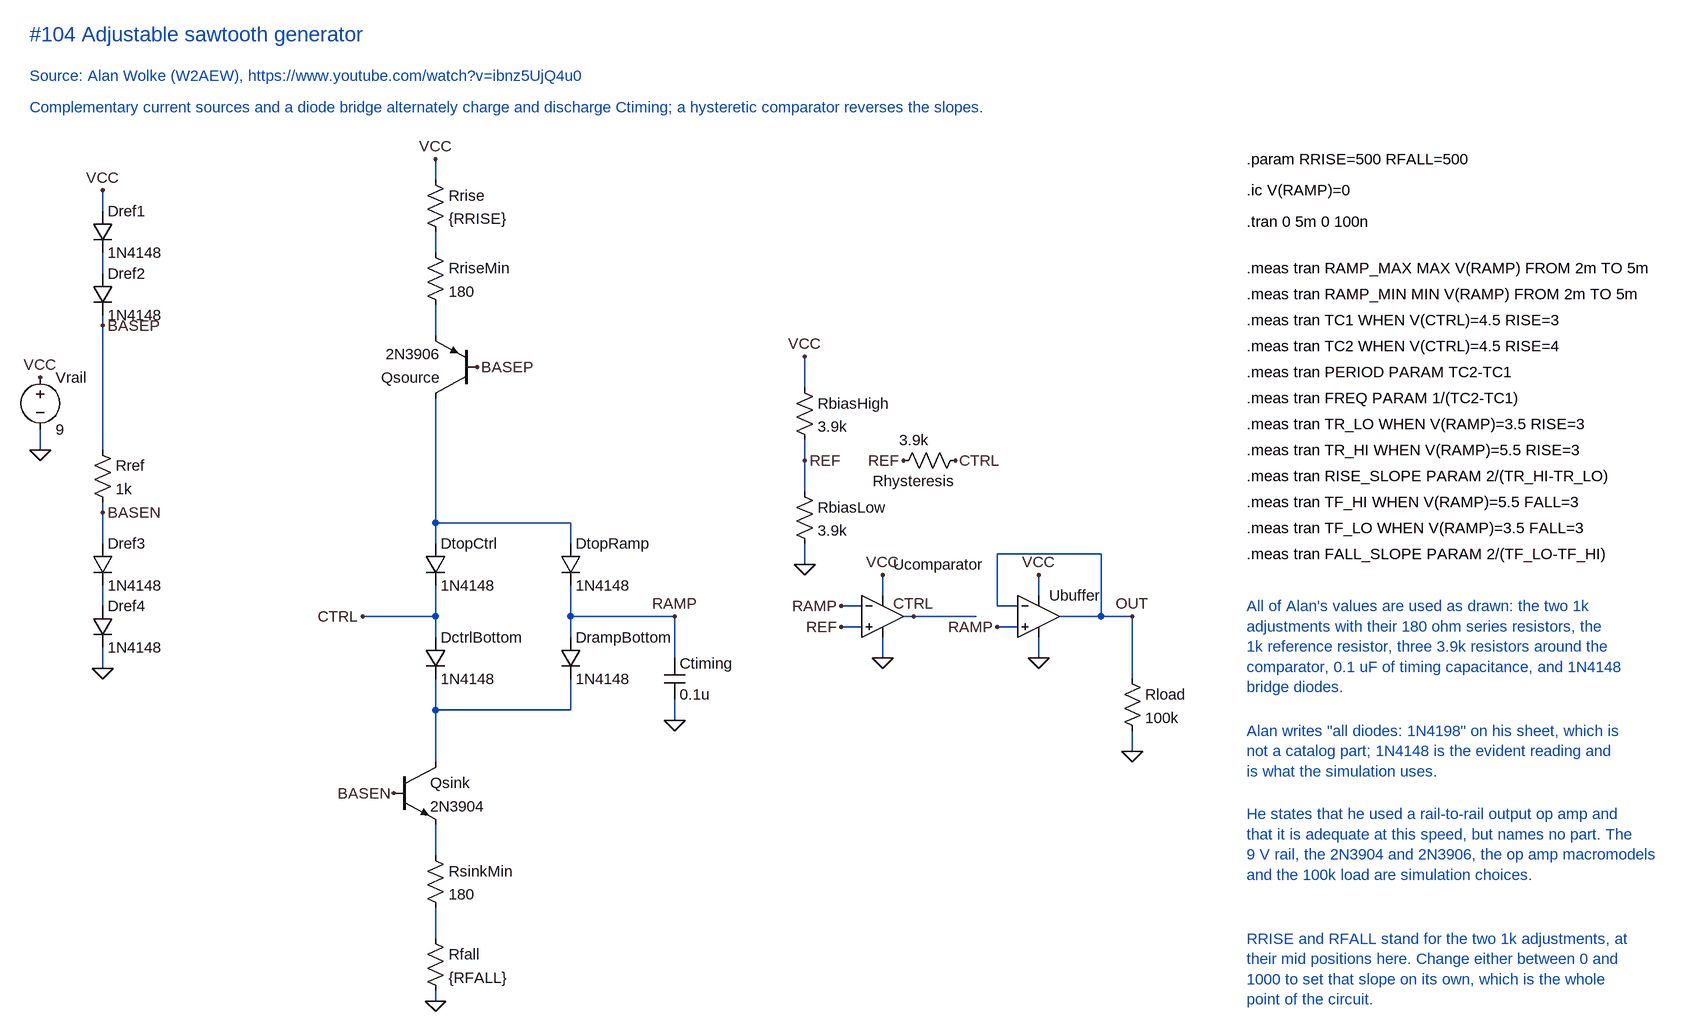
[diagram p0: schematic Adjustable sawtooth generator.asc]
Adjustable sawtooth generator.asc, the LTspice schematic file:
Version 4.1
SHEET 1 1900 1650
WIRE 64 80 64 48
WIRE 160 -320 160 -288
WIRE 160 -224 160 -192
WIRE 160 -128 160 -112
WIRE 160 -112 160 80
WIRE 160 160 160 176
WIRE 160 176 160 224
WIRE 160 288 160 320
WIRE 160 384 160 416
WIRE 672 -368 672 -336
WIRE 672 -256 672 -224
WIRE 672 -144 672 -96
WIRE 672 192 672 0
WIRE 672 224 672 192
WIRE 672 336 672 288
WIRE 672 368 672 336
WIRE 672 480 672 432
WIRE 672 560 672 480
WIRE 672 704 672 656
WIRE 672 832 672 784
WIRE 672 928 672 912
WIRE 880 192 672 192
WIRE 880 224 880 192
WIRE 880 336 880 288
WIRE 880 368 880 336
WIRE 880 480 880 432
WIRE 880 480 672 480
WIRE 560 336 672 336
WIRE 1040 336 880 336
WIRE 1040 400 1040 336
WIRE 1040 496 1040 464
WIRE 1240 -64 1240 -16
WIRE 1240 96 1240 64
WIRE 1240 144 1240 96
WIRE 1240 256 1240 224
WIRE 1360 304 1360 272
WIRE 1360 400 1360 368
WIRE 1296 320 1328 320
WIRE 1296 352 1328 352
WIRE 1504 336 1392 336
WIRE 1568 352 1536 352
WIRE 1600 304 1600 272
WIRE 1600 400 1600 368
WIRE 1696 336 1632 336
WIRE 1744 336 1696 336
WIRE 1744 432 1744 336
WIRE 1744 544 1744 512
WIRE 1696 240 1696 336
WIRE 1536 240 1696 240
WIRE 1536 320 1536 240
WIRE 1568 320 1536 320
FLAG 64 -32 VCC
FLAG 64 80 0
FLAG 160 -320 VCC
FLAG 160 -112 BASEP
FLAG 160 176 BASEN
FLAG 160 416 0
FLAG 672 -368 VCC
FLAG 736 -48 BASEP
FLAG 608 608 BASEN
FLAG 672 928 0
FLAG 560 336 CTRL
FLAG 1040 336 RAMP
FLAG 1040 496 0
FLAG 1240 -64 VCC
FLAG 1240 96 REF
FLAG 1240 256 0
FLAG 1392 96 REF
FLAG 1472 96 CTRL
FLAG 1296 320 RAMP
FLAG 1296 352 REF
FLAG 1360 272 VCC
FLAG 1360 400 0
FLAG 1408 336 CTRL
FLAG 1536 352 RAMP
FLAG 1600 272 VCC
FLAG 1600 400 0
FLAG 1744 336 OUT
FLAG 1744 544 0
SYMBOL voltage 64 -48 R0
SYMATTR InstName Vrail
SYMATTR Value 9
SYMBOL diode 144 -288 R0
SYMATTR InstName Dref1
SYMATTR Value 1N4148
SYMBOL diode 144 -192 R0
SYMATTR InstName Dref2
SYMATTR Value 1N4148
SYMBOL res 144 64 R0
SYMATTR InstName Rref
SYMATTR Value 1k
SYMBOL diode 144 224 R0
SYMATTR InstName Dref3
SYMATTR Value 1N4148
SYMBOL diode 144 320 R0
SYMATTR InstName Dref4
SYMATTR Value 1N4148
SYMBOL res 656 -352 R0
SYMATTR InstName Rrise
SYMATTR Value {RRISE}
SYMBOL res 656 -240 R0
SYMATTR InstName RriseMin
SYMATTR Value 180
SYMBOL pnp 736 0 R180
SYMATTR InstName Qsource
SYMATTR Value 2N3906
SYMBOL diode 656 224 R0
SYMATTR InstName DtopCtrl
SYMATTR Value 1N4148
SYMBOL diode 864 224 R0
SYMATTR InstName DtopRamp
SYMATTR Value 1N4148
SYMBOL diode 656 368 R0
SYMATTR InstName DctrlBottom
SYMATTR Value 1N4148
SYMBOL diode 864 368 R0
SYMATTR InstName DrampBottom
SYMATTR Value 1N4148
SYMBOL npn 608 560 R0
SYMATTR InstName Qsink
SYMATTR Value 2N3904
SYMBOL res 656 688 R0
SYMATTR InstName RsinkMin
SYMATTR Value 180
SYMBOL res 656 816 R0
SYMATTR InstName Rfall
SYMATTR Value {RFALL}
SYMBOL cap 1024 400 R0
SYMATTR InstName Ctiming
SYMATTR Value 0.1u
SYMBOL res 1224 -32 R0
SYMATTR InstName RbiasHigh
SYMATTR Value 3.9k
SYMBOL res 1224 128 R0
SYMATTR InstName RbiasLow
SYMATTR Value 3.9k
SYMBOL res 1376 112 R270
WINDOW 0 0 32 VBottom 2
WINDOW 3 32 32 VTop 2
SYMATTR InstName Rhysteresis
SYMATTR Value 3.9k
SYMBOL Opamps\UniversalOpAmp2 1360 336 R0
WINDOW 0 16 -80 Left 2
SYMATTR InstName Ucomparator
SYMBOL Opamps\UniversalOpAmp2 1600 336 R0
SYMATTR InstName Ubuffer
SYMBOL res 1728 416 R0
SYMATTR InstName Rload
SYMATTR Value 100k
TEXT 48 -560 Left 3 ;#104 Adjustable sawtooth generator
TEXT 48 -496 Left 2 ;Source: Alan Wolke (W2AEW), https://www.youtube.com/watch?v=ibnz5UjQ4u0
TEXT 48 -448 Left 2 ;Complementary current sources and a diode bridge alternately charge and discharge Ctiming; a hysteretic comparator reverses the slopes.
TEXT 1920 -368 Left 2 !.param RRISE=500 RFALL=500
TEXT 1920 -320 Left 2 !.ic V(RAMP)=0
TEXT 1920 -272 Left 2 !.tran 0 5m 0 100n
TEXT 1920 -200 Left 2 !.meas tran RAMP_MAX MAX V(RAMP) FROM 2m TO 5m
TEXT 1920 -160 Left 2 !.meas tran RAMP_MIN MIN V(RAMP) FROM 2m TO 5m
TEXT 1920 -120 Left 2 !.meas tran TC1 WHEN V(CTRL)=4.5 RISE=3
TEXT 1920 -80 Left 2 !.meas tran TC2 WHEN V(CTRL)=4.5 RISE=4
TEXT 1920 -40 Left 2 !.meas tran PERIOD PARAM TC2-TC1
TEXT 1920 0 Left 2 !.meas tran FREQ PARAM 1/(TC2-TC1)
TEXT 1920 40 Left 2 !.meas tran TR_LO WHEN V(RAMP)=3.5 RISE=3
TEXT 1920 80 Left 2 !.meas tran TR_HI WHEN V(RAMP)=5.5 RISE=3
TEXT 1920 120 Left 2 !.meas tran RISE_SLOPE PARAM 2/(TR_HI-TR_LO)
TEXT 1920 160 Left 2 !.meas tran TF_HI WHEN V(RAMP)=5.5 FALL=3
TEXT 1920 200 Left 2 !.meas tran TF_LO WHEN V(RAMP)=3.5 FALL=3
TEXT 1920 240 Left 2 !.meas tran FALL_SLOPE PARAM 2/(TF_LO-TF_HI)
TEXT 1920 320 Left 2 ;All of Alan's values are used as drawn: the two 1k\nadjustments with their 180 ohm series resistors, the\n1k reference resistor, three 3.9k resistors around the\ncomparator, 0.1 uF of timing capacitance, and 1N4148\nbridge diodes.
TEXT 1920 512 Left 2 ;Alan writes "all diodes: 1N4198" on his sheet, which is\nnot a catalog part; 1N4148 is the evident reading and\nis what the simulation uses.
TEXT 1920 640 Left 2 ;He states that he used a rail-to-rail output op amp and\nthat it is adequate at this speed, but names no part. The\n9 V rail, the 2N3904 and 2N3906, the op amp macromodels\nand the 100k load are simulation choices.
TEXT 1920 832 Left 2 ;RRISE and RFALL stand for the two 1k adjustments, at\ntheir mid positions here. Change either between 0 and\n1000 to set that slope on its own, which is the whole\npoint of the circuit.

The netlist it stands for:
* Adjustable sawtooth generator.asc
Vrail VCC 0 9
Dref1 VCC N001 1N4148
Dref2 N001 BASEP 1N4148
Rref BASEP BASEN 1k
Dref3 BASEN N002 1N4148
Dref4 N002 0 1N4148
Rrise VCC N003 {RRISE}
RriseMin N003 N004 180
Qsource N005 BASEP N004 0 2N3906
DtopCtrl N005 CTRL 1N4148
DtopRamp N005 RAMP 1N4148
DctrlBottom CTRL N006 1N4148
DrampBottom RAMP N006 1N4148
Qsink N006 BASEN N007 0 2N3904
RsinkMin N007 N008 180
Rfall N008 0 {RFALL}
Ctiming RAMP 0 0.1u
RbiasHigh VCC REF 3.9k
RbiasLow REF 0 3.9k
Rhysteresis REF CTRL 3.9k
X§Ucomparator REF RAMP VCC 0 CTRL level2 Avol=1Meg GBW=10Meg Slew=10Meg Ilimit=25m Rail=0 Vos=0 En=0 Enk=0 In=0 Ink=0 Rin=500Meg  ; pins In+ In- V+ V- OUT
X§Ubuffer RAMP OUT VCC 0 OUT level2 Avol=1Meg GBW=10Meg Slew=10Meg Ilimit=25m Rail=0 Vos=0 En=0 Enk=0 In=0 Ink=0 Rin=500Meg  ; pins In+ In- V+ V- OUT
Rload OUT 0 100k
.model D D
.lib standard.dio
.model NPN NPN
.model PNP PNP
.lib standard.bjt
* #104 Adjustable sawtooth generator
* Source: Alan Wolke (W2AEW), https://www.youtube.com/watch?v=ibnz5UjQ4u0
* Complementary current sources and a diode bridge alternately charge and discharge Ctiming; a hysteretic comparator reverses the slopes.
.param RRISE=500 RFALL=500
.ic V(RAMP)=0
.tran 0 5m 0 100n
.meas tran RAMP_MAX MAX V(RAMP) FROM 2m TO 5m
.meas tran RAMP_MIN MIN V(RAMP) FROM 2m TO 5m
.meas tran TC1 WHEN V(CTRL)=4.5 RISE=3
.meas tran TC2 WHEN V(CTRL)=4.5 RISE=4
.meas tran PERIOD PARAM TC2-TC1
.meas tran FREQ PARAM 1/(TC2-TC1)
.meas tran TR_LO WHEN V(RAMP)=3.5 RISE=3
.meas tran TR_HI WHEN V(RAMP)=5.5 RISE=3
.meas tran RISE_SLOPE PARAM 2/(TR_HI-TR_LO)
.meas tran TF_HI WHEN V(RAMP)=5.5 FALL=3
.meas tran TF_LO WHEN V(RAMP)=3.5 FALL=3
.meas tran FALL_SLOPE PARAM 2/(TF_LO-TF_HI)
* All of Alan's values are used as drawn: the two 1k
* adjustments with their 180 ohm series resistors, the
* 1k reference resistor, three 3.9k resistors around the
* comparator, 0.1 uF of timing capacitance, and 1N4148
* bridge diodes.
* Alan writes "all diodes: 1N4198" on his sheet, which is
* not a catalog part; 1N4148 is the evident reading and
* is what the simulation uses.
* He states that he used a rail-to-rail output op amp and
* that it is adequate at this speed, but names no part. The
* 9 V rail, the 2N3904 and 2N3906, the op amp macromodels
* and the 100k load are simulation choices.
* RRISE and RFALL stand for the two 1k adjustments, at
* their mid positions here. Change either between 0 and
* 1000 to set that slope on its own, which is the whole
* point of the circuit.
.lib UniversalOpAmp2.lib
.backanno
.end